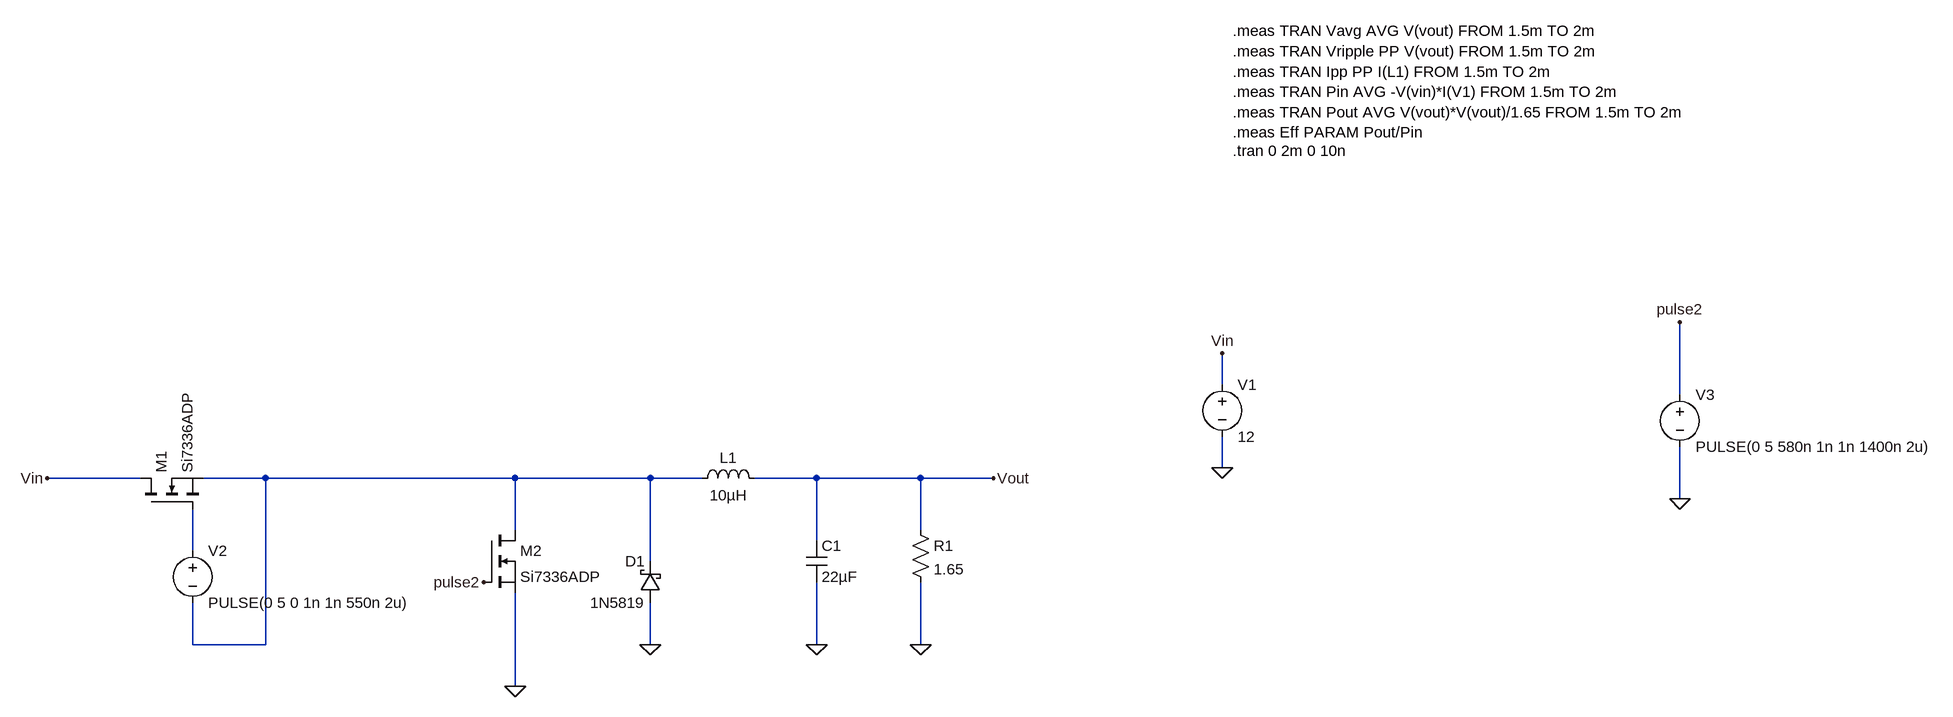
[diagram p0: schematic Buck_real.asc]
Buck_real.asc, the LTspice schematic file:
Version 4.1
SHEET 1 1692 1064
WIRE 576 272 576 224
WIRE 1280 288 1280 176
WIRE 576 400 576 352
WIRE -1088 416 -1232 416
WIRE -896 416 -992 416
WIRE -512 416 -896 416
WIRE -304 416 -512 416
WIRE -224 416 -304 416
WIRE -48 416 -144 416
WIRE 112 416 -48 416
WIRE 224 416 112 416
WIRE 1280 448 1280 368
WIRE -512 496 -512 416
WIRE 112 496 112 416
WIRE -48 512 -48 416
WIRE -1008 528 -1008 464
WIRE -304 544 -304 416
WIRE -1008 672 -1008 608
WIRE -896 672 -896 416
WIRE -896 672 -1008 672
WIRE -304 672 -304 608
WIRE -48 672 -48 576
WIRE 112 672 112 576
WIRE -512 736 -512 592
FLAG 576 400 0
FLAG 576 224 Vin
FLAG -1232 416 Vin
FLAG -304 672 0
FLAG -48 672 0
FLAG 112 672 0
FLAG 224 416 Vout
FLAG -512 736 0
FLAG 1280 448 0
FLAG 1280 176 pulse2
FLAG -560 576 pulse2
SYMBOL voltage 576 256 R0
WINDOW 123 0 0 Left 0
WINDOW 39 0 0 Left 0
SYMATTR InstName V1
SYMATTR Value 12
SYMBOL voltage -1008 512 R0
WINDOW 123 0 0 Left 0
WINDOW 39 0 0 Left 0
SYMATTR InstName V2
SYMATTR Value PULSE(0 5 0 1n 1n 550n 2u)
SYMBOL schottky -288 608 R180
WINDOW 0 24 64 Left 2
WINDOW 3 24 0 Left 2
SYMATTR InstName D1
SYMATTR Value 1N5819
SYMBOL ind -240 432 R270
WINDOW 0 32 56 VTop 2
WINDOW 3 5 56 VBottom 2
SYMATTR InstName L1
SYMATTR Value 10µH
SYMATTR SpiceLine Rser=1m
SYMBOL cap -64 512 R0
SYMATTR InstName C1
SYMATTR Value 22µF
SYMBOL res 96 480 R0
SYMATTR InstName R1
SYMATTR Value 1.65
SYMBOL voltage 1280 272 R0
WINDOW 123 0 0 Left 0
WINDOW 39 0 0 Left 0
SYMATTR InstName V3
SYMATTR Value PULSE(0 5 580n 1n 1n 1400n 2u)
SYMBOL nmos -1088 464 R270
SYMATTR InstName M1
SYMATTR Value Si7336ADP
SYMBOL nmos -560 496 R0
SYMATTR InstName M2
SYMATTR Value Si7336ADP
TEXT 592 -88 Left 2 !.tran 0 2m 0 10n
TEXT 592 -272 Left 2 !.meas TRAN Vavg AVG V(vout) FROM 1.5m TO 2m\n.meas TRAN Vripple PP V(vout) FROM 1.5m TO 2m\n.meas TRAN Ipp PP I(L1) FROM 1.5m TO 2m\n.meas TRAN Pin AVG -V(vin)*I(V1) FROM 1.5m TO 2m\n.meas TRAN Pout AVG V(vout)*V(vout)/1.65 FROM 1.5m TO 2m\n.meas Eff PARAM Pout/Pin

The netlist it stands for:
* Buck_real.asc
V1 Vin 0 12
V2 N002 N001 PULSE(0 5 0 1n 1n 550n 2u)
D1 0 N001 1N5819
L1 N001 Vout 10µH Rser=1m
C1 Vout 0 22µF
R1 Vout 0 1.65
V3 pulse2 0 PULSE(0 5 580n 1n 1n 1400n 2u)
M1 Vin N002 N001 N001 Si7336ADP
M2 N001 pulse2 0 0 Si7336ADP
.model D D
.lib standard.dio
.model NMOS NMOS
.model PMOS PMOS
.lib standard.mos
.tran 0 2m 0 10n
.meas TRAN Vavg AVG V(vout) FROM 1.5m TO 2m
.meas TRAN Vripple PP V(vout) FROM 1.5m TO 2m
.meas TRAN Ipp PP I(L1) FROM 1.5m TO 2m
.meas TRAN Pin AVG -V(vin)*I(V1) FROM 1.5m TO 2m
.meas TRAN Pout AVG V(vout)*V(vout)/1.65 FROM 1.5m TO 2m
.meas Eff PARAM Pout/Pin
.backanno
.end